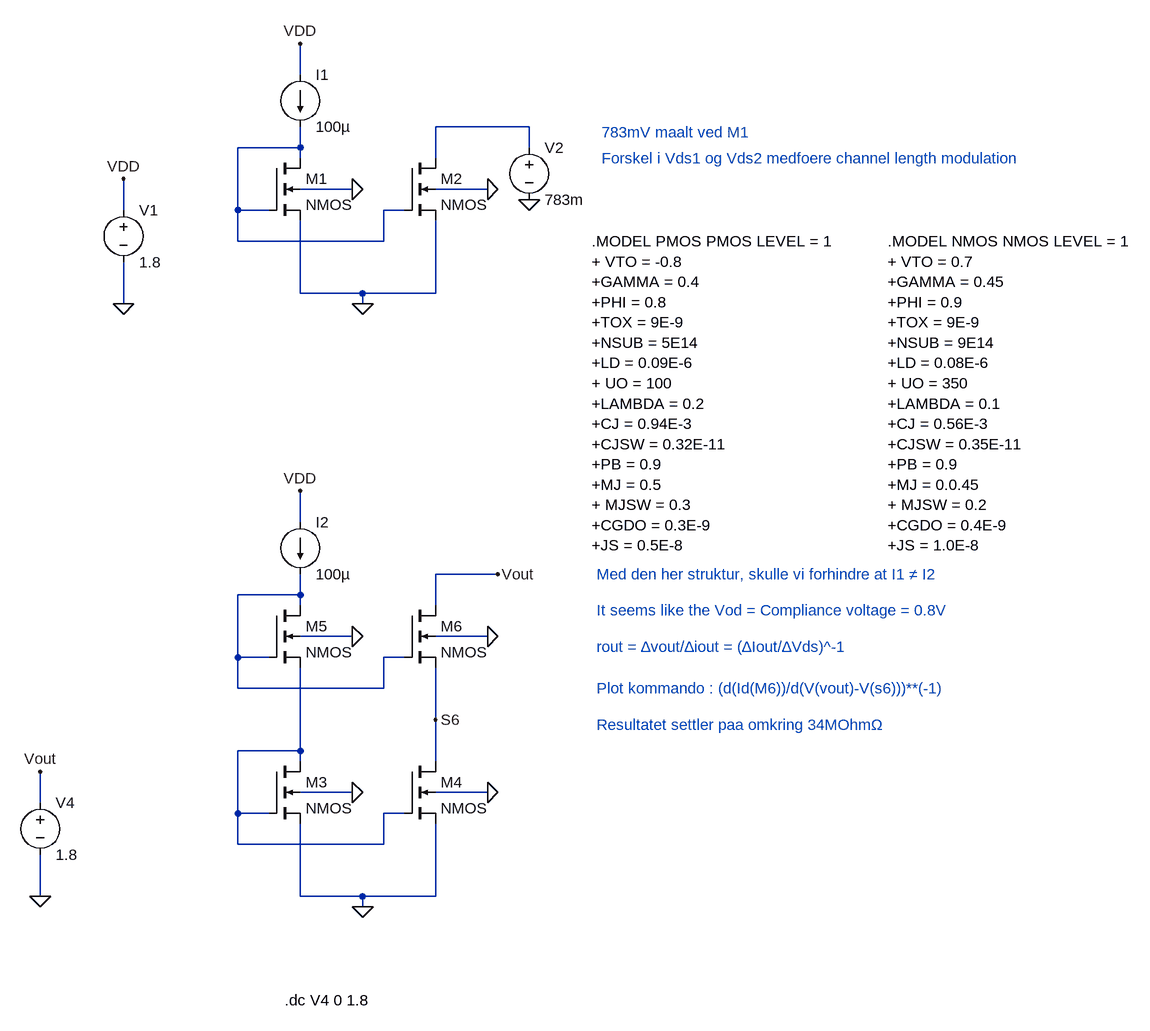
[diagram p0: schematic Lab5.asc]
Lab5.asc, the LTspice schematic file:
Version 4
SHEET 1 1456 1424
WIRE 208 -16 208 -64
WIRE 560 64 416 64
WIRE 208 96 208 64
WIRE 208 96 112 96
WIRE 560 96 560 64
WIRE 208 112 208 96
WIRE 416 112 416 64
WIRE 288 160 208 160
WIRE 496 160 416 160
WIRE -64 192 -64 144
WIRE 112 192 112 96
WIRE 160 192 112 192
WIRE 368 192 336 192
WIRE 112 240 112 192
WIRE 336 240 336 192
WIRE 336 240 112 240
WIRE 208 320 208 208
WIRE 304 320 208 320
WIRE 416 320 416 208
WIRE 416 320 304 320
WIRE -64 336 -64 272
WIRE 304 336 304 320
WIRE 208 672 208 624
WIRE 512 752 416 752
WIRE 208 784 208 752
WIRE 208 784 112 784
WIRE 208 800 208 784
WIRE 416 800 416 752
WIRE 288 848 208 848
WIRE 496 848 416 848
WIRE 112 880 112 784
WIRE 160 880 112 880
WIRE 368 880 336 880
WIRE 112 928 112 880
WIRE 336 928 336 880
WIRE 336 928 112 928
WIRE 416 976 416 896
WIRE 208 1024 208 896
WIRE 208 1024 112 1024
WIRE 208 1040 208 1024
WIRE 416 1040 416 976
WIRE 288 1088 208 1088
WIRE 496 1088 416 1088
WIRE -192 1104 -192 1056
WIRE 112 1120 112 1024
WIRE 160 1120 112 1120
WIRE 368 1120 336 1120
WIRE 112 1168 112 1120
WIRE 336 1168 336 1120
WIRE 336 1168 112 1168
WIRE -192 1248 -192 1184
WIRE 208 1248 208 1136
WIRE 304 1248 208 1248
WIRE 416 1248 416 1136
WIRE 416 1248 304 1248
WIRE 304 1264 304 1248
FLAG 304 336 0
FLAG -64 336 0
FLAG -64 144 VDD
FLAG 560 176 0
FLAG 304 1264 0
FLAG 208 624 VDD
FLAG 512 752 Vout
FLAG -192 1248 0
FLAG -192 1056 Vout
FLAG 208 -64 VDD
FLAG 416 976 S6
FLAG 288 160 0
FLAG 496 160 0
FLAG 288 848 0
FLAG 496 848 0
FLAG 288 1088 0
FLAG 496 1088 0
SYMBOL nmos4 160 112 R0
SYMATTR InstName M1
SYMATTR Value2 l=200nm w=8um
SYMBOL nmos4 368 112 R0
SYMATTR InstName M2
SYMATTR Value2 l=200nm w=8um
SYMBOL Voltage -64 176 R0
SYMATTR InstName V1
SYMATTR Value 1.8
SYMBOL current 208 -16 R0
SYMATTR InstName I1
SYMATTR Value 100µ
SYMBOL Voltage 560 80 R0
SYMATTR InstName V2
SYMATTR Value 783m
SYMBOL nmos4 160 1040 R0
SYMATTR InstName M3
SYMATTR Value2 l=200nm w=8um
SYMBOL nmos4 368 1040 R0
SYMATTR InstName M4
SYMATTR Value2 l=200nm w=8um
SYMBOL nmos4 160 800 R0
SYMATTR InstName M5
SYMATTR Value2 l=200nm w=8um
SYMBOL nmos4 368 800 R0
SYMATTR InstName M6
SYMATTR Value2 l=200nm w=8um
SYMBOL current 208 672 R0
SYMATTR InstName I2
SYMATTR Value 100µ
SYMBOL Voltage -192 1088 R0
SYMATTR InstName V4
SYMATTR Value 1.8
TEXT 656 240 Left 2 !.MODEL PMOS PMOS LEVEL = 1\n+ VTO = -0.8\n+GAMMA = 0.4\n+PHI = 0.8\n+TOX = 9E-9\n+NSUB = 5E14\n+LD = 0.09E-6\n+ UO = 100\n+LAMBDA = 0.2\n+CJ = 0.94E-3\n+CJSW = 0.32E-11\n+PB = 0.9\n+MJ = 0.5\n+ MJSW = 0.3\n+CGDO = 0.3E-9\n+JS = 0.5E-8
TEXT 1112 240 Left 2 !.MODEL NMOS NMOS LEVEL = 1\n+ VTO = 0.7\n+GAMMA = 0.45\n+PHI = 0.9\n+TOX = 9E-9\n+NSUB = 9E14\n+LD = 0.08E-6\n+ UO = 350\n+LAMBDA = 0.1\n+CJ = 0.56E-3\n+CJSW = 0.35E-11\n+PB = 0.9\n+MJ = 0.0.45\n+ MJSW = 0.2\n+CGDO = 0.4E-9\n+JS = 1.0E-8
TEXT 672 72 Left 2 ;783mV maalt ved M1
TEXT 672 112 Left 2 ;Forskel i Vds1 og Vds2 medfoere channel length modulation
TEXT 664 752 Left 2 ;Med den her struktur, skulle vi forhindre at I1 ≠ I2
TEXT 184 1408 Left 2 !.dc V4 0 1.8
TEXT 664 808 Left 2 ;It seems like the Vod = Compliance voltage = 0.8V
TEXT 664 864 Left 2 ;rout = ∆vout/∆iout = (∆Iout/∆Vds)^-1
TEXT 664 928 Left 2 ;Plot kommando : (d(Id(M6))/d(V(vout)-V(s6)))**(-1)
TEXT 664 984 Left 2 ;Resultatet settler paa omkring 34MOhmΩ

The netlist it stands for:
* Lab5.asc
M1 N002 N002 0 0 NMOS l=200nm w=8um
M2 N001 N002 0 0 NMOS l=200nm w=8um
V1 VDD 0 1.8
I1 VDD N002 100µ
V2 N001 0 783m
M3 N004 N004 0 0 NMOS l=200nm w=8um
M4 S6 N004 0 0 NMOS l=200nm w=8um
M5 N003 N003 N004 0 NMOS l=200nm w=8um
M6 Vout N003 S6 0 NMOS l=200nm w=8um
I2 VDD N003 100µ
V4 Vout 0 1.8
.model NMOS NMOS
.model PMOS PMOS
.lib standard.mos
.MODEL PMOS PMOS LEVEL = 1
+ VTO = -0.8
+GAMMA = 0.4
+PHI = 0.8
+TOX = 9E-9
+NSUB = 5E14
+LD = 0.09E-6
+ UO = 100
+LAMBDA = 0.2
+CJ = 0.94E-3
+CJSW = 0.32E-11
+PB = 0.9
+MJ = 0.5
+ MJSW = 0.3
+CGDO = 0.3E-9
+JS = 0.5E-8
.MODEL NMOS NMOS LEVEL = 1
+ VTO = 0.7
+GAMMA = 0.45
+PHI = 0.9
+TOX = 9E-9
+NSUB = 9E14
+LD = 0.08E-6
+ UO = 350
+LAMBDA = 0.1
+CJ = 0.56E-3
+CJSW = 0.35E-11
+PB = 0.9
+MJ = 0.0.45
+ MJSW = 0.2
+CGDO = 0.4E-9
+JS = 1.0E-8
* 783mV maalt ved M1
* Forskel i Vds1 og Vds2 medfoere channel length modulation
* Med den her struktur, skulle vi forhindre at I1 ≠ I2
.dc V4 0 1.8
* It seems like the Vod = Compliance voltage = 0.8V
* rout = ∆vout/∆iout = (∆Iout/∆Vds)^-1
* Plot kommando : (d(Id(M6))/d(V(vout)-V(s6)))**(-1)
* Resultatet settler paa omkring 34MOhmΩ
.backanno
.end